# Altium schematic sheet PIC16F887.SchDoc
size A4
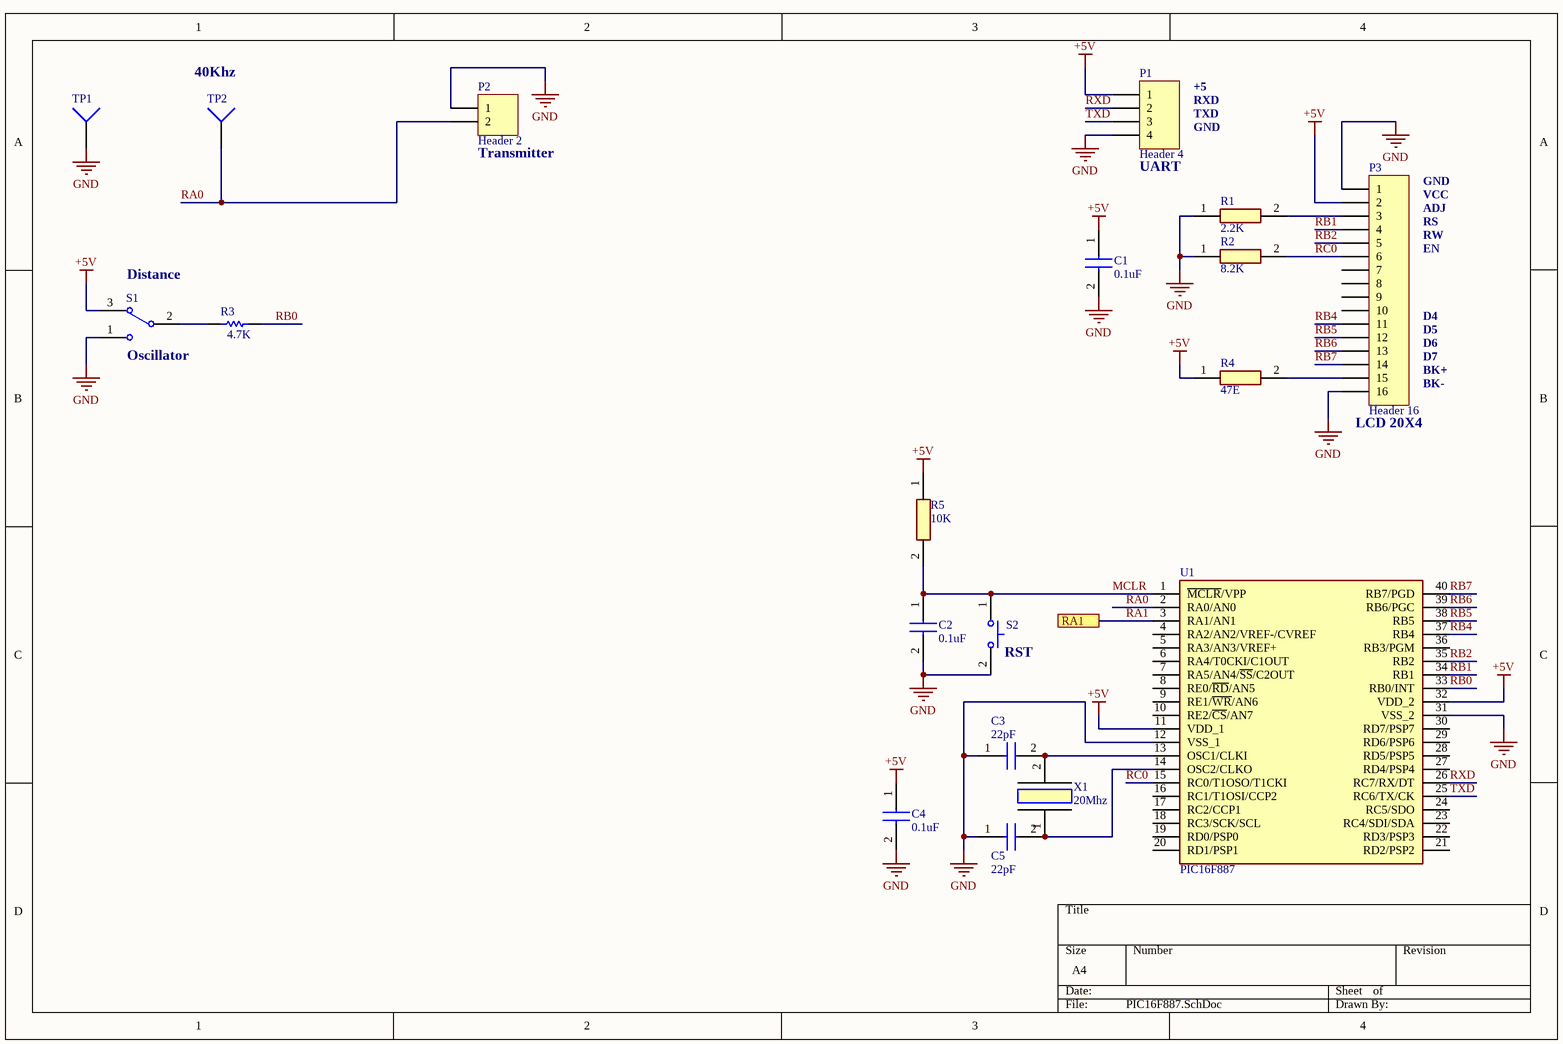
[diagram p0: PIC16F887.SchDoc]

## Parts
C1  0.1uF  [1C10X7R104K050B]
C2  0.1uF  [1C10X7R104K050B]
C3  22pF  [1C10X7R104K050B]
C4  0.1uF  [1C10X7R104K050B]
C5  22pF  [1C10X7R104K050B]
P1  Header 4  [HDR1X4]
P2  Header 2  [HDR1X2]
P3  Header 16  [HDR1X16]
R1  2.2K  [RESC3216X75N]
R2  8.2K  [RESC3216X75N]
R3  value 4.7K  [AXIAL-0.3]  (hidden comment: Res1)
R4  47E  [RESC3216X75N]
R5  10K  [RESC3216X75N]
S1  SW-SPDT  [TL36WW15050]  (value not drawn)
S2  SW_2PIN  [FSM2JRT]  (value not drawn)
TP1  Socket  [PIN1]  (value not drawn)
TP2  Socket  [PIN1]  (value not drawn)
U1  PIC16F887  [DIP1550W56P254L5219H483Q40N]
X1  20Mhz  [9B112896MEEJB]

## Ports
RA1

## Nets
+5V: C1.1 C4.1 P1.1 P3.2 R4.1 R5.1 S1.3 U1.11(VDD_1) U1.32(VDD_2)
GND: C1.2 C2.2 C3.1 C4.2 C5.1 P1.4 P2.1 P3.1 P3.16 R1.1 R2.1 S1.1 S2.2(NO) TP1.1 U1.12(VSS_1) U1.31(VSS_2)
MCLR: C2.1 R5.2 S2.1(COM) U1.1(~{MCLR}/VPP)
RA0: P2.2 TP2.1 U1.2(RA0/AN0)
RA1: U1.3(RA1/AN1) ; port RA1
RB0: R3.2 U1.33(RB0/INT)
RB1: P3.4 U1.34(RB1)
RB2: P3.5 U1.35(RB2)
RB4: P3.11 U1.37(RB4)
RB5: P3.12 U1.38(RB5)
RB6: P3.13 U1.39(RB6/PGC)
RB7: P3.14 U1.40(RB7/PGD)
RC0: P3.6 R2.2 U1.15(RC0/T1OSO/T1CKI)
RXD: P1.2 U1.26(RC7/RX/DT)
TXD: P1.3 U1.25(RC6/TX/CK)
NetC3_2: C3.2 U1.13(OSC1/CLKI) X1.2(CRYSTAL_2)
NetC5_2: C5.2 U1.14(OSC2/CLKO) X1.1(CRYSTAL_1)
NetP3_3: P3.3 R1.2
NetP3_15: P3.15 R4.2
NetR3_1: R3.1 S1.2

Not connected (* = marked no-connect by the designer): P3 7 8 9 10; U1 4(RA2/AN2/VREF-/CVREF) 5(RA3/AN3/VREF+) 6(RA4/T0CKI/C1OUT) 7(RA5/AN4/~{SS}/C2OUT) 8(RE0/~{RD}/AN5) 9(RE1/~{WR}/AN6) 10(RE2/~{CS}/AN7) 16(RC1/T1OSI/CCP2) 17(RC2/CCP1) 18(RC3/SCK/SCL) 19(RD0/PSP0) 20(RD1/PSP1) 21(RD2/PSP2) 22(RD3/PSP3) 23(RC4/SDI/SDA) 24(RC5/SDO) 27(RD4/PSP4) 28(RD5/PSP5) 29(RD6/PSP6) 30(RD7/PSP7) 36(RB3/PGM)

## Notes on the sheet
- (near TP2) 40Khz
- TXD
- RXD
- +5
- (near P2) Transmitter
- (near P1) UART
- GND
- RS
- RW
- EN
- VCC
- ADJ
- (near S1) Distance
- D4
- (near S1) Oscillator
- D5
- D6
- D7
- BK+
- BK-
- (near P3) LCD 20X4
- (near S2) RST

## Library data of the parts
C1-C5 = Cap_Disc_TH: Capacitor; Manufacturer_Name: Vishay; Datasheet Link: https://componentsearchengine.com/Datasheets/2/1C10X7R104K050B.pdf; Height: 6.35mm; Manufacturer_Part_Number: 1C10X7R104K050B; Arrow Part Number: 1C10X7R104K050B; Arrow Price/Stock: https://www.arrow.com/en/products/1c10x7r104k050b/vishay; Mouser Part Number: 75-1C10X7R104K050B; Mouser Price/Stock: https://www.mouser.co.uk/ProductDetail/Vishay/1C10X7R104K050B?qs=TIBb6vrNf0T8HspN1t%2FgBg%3D%3D
P1 = Header 4: Header, 4-Pin; LatestRevisionDate: 17-Jul-2002; LatestRevisionNote: Re-released for DXP Platform.; Publisher: Altium Limited
P2 = Header 2: Header, 2-Pin; LatestRevisionDate: 17-Jul-2002; LatestRevisionNote: Re-released for DXP Platform.; Publisher: Altium Limited
P3 = Header 16: Header, 16-Pin; LatestRevisionDate: 17-Jul-2002; LatestRevisionNote: Re-released for DXP Platform.; Publisher: Altium Limited
R1 R2 R4 R5 = R1206: Resistor; Manufacturer_Name: Bourns; Manufacturer_Part_Number: CR1206-FX-1001ELF; Allied_Number: 70155095; Datasheet Link: http://www.bourns.com/data/global/pdfs/CHPREZTR.pdf; Height: 0.75mm; Mouser Part Number: 652-CR1206FX-1001ELF; Mouser Price/Stock: https://www.mouser.com/Search/Refine.aspx?Keyword=652-CR1206FX-1001ELF; RS Part Number: 7409088P; RS Price/Stock: http://uk.rs-online.com/web/p/products/7409088P; Allied Price/Stock: http://www.alliedelec.com/bourns-cr1206-fx-1001elf/70155095/
R3 = Res1: Resistor; Published: 8-Jun-2000; LatestRevisionDate: 17-Jul-2002; LatestRevisionNote: Re-released for DXP Platform.; PackageReference: AXIAL-0.3; Publisher: Altium Limited; PackageDescription: Axial Device, Thru-Hole; 2 Leads; 0.3 in Pin Spacing
S1 = SW-SPDT: SPDT Subminiature Toggle Switch, Right Angle Mounting, Vertical Actuation; Published: 24-Mar-1999; LatestRevisionDate: 17-Dec-2003; LatestRevisionNote: Schematic revised, PCB Footprint replaced.; DatasheetVersion: 05-Dec-2000; PackageReference: TL36WW15050; Publisher: Altium Limited; PackageDescription: Switch; 4 Leads; ComponentLink1Description: Manufacturer Link; ComponentLink1URL: http://www.apem.com
S2 = SW_2PIN: Switch (2-Pin Push); Manufacturer_Name: TE Connectivity; Datasheet Link: http://www.farnell.com/datasheets/2074947.pdf; Height: 4.3mm; Manufacturer_Part_Number: FSM2JRT; Arrow Part Number: FSM2JRT; Arrow Price/Stock: https://www.arrow.com/en/products/fsm2jrt/te-connectivity; Mouser Part Number: 506-FSM2JRT; Mouser Price/Stock: https://www.mouser.co.uk/ProductDetail/TE-Connectivity-PB/FSM2JRT?qs=g%252BEszo6zu8OVk6hda53nSw%3D%3D
U1 = PIC16F877A-E_P: Integrated Circuit; Manufacturer_Name: Microchip; Manufacturer_Part_Number: PIC16F877A-E/P; Datasheet Link: https://datasheet.datasheetarchive.com/originals/distributors/Datasheets-18/DSA-359049.pdf; Height: 4.83mm; Mouser Part Number: 579-PIC16F877A-E/P; Mouser Price/Stock: https://www.mouser.co.uk/ProductDetail/Microchip-Technology-Atmel/PIC16F877A-E-P?qs=oKK8NaWdAJsQw%252B2Y417CHw%3D%3D; Arrow Part Number: PIC16F877A-E/P; Arrow Price/Stock: https://www.arrow.com/en/products/pic16f877a-ep/microchip-technology?region=nac
X1 = Crystal_ThruHole: Crystal or Oscillator; Manufacturer_Name: TXC; Manufacturer_Part_Number: 9B-11.2896MEEJ-B; Datasheet Link: https://www.arrow.com/en/products/9b-11.2896meej-b/txc-corporation; Height: 3.68mm; Arrow Part Number: 9B-11.2896MEEJ-B; Arrow Price/Stock: https://www.arrow.com/en/products/9b-11.2896meej-b/txc-corporation
TP1 TP2 = Socket: LatestRevisionDate: 17-Jul-2002; LatestRevisionNote: Re-released for DXP Platform.; Publisher: Altium Limited